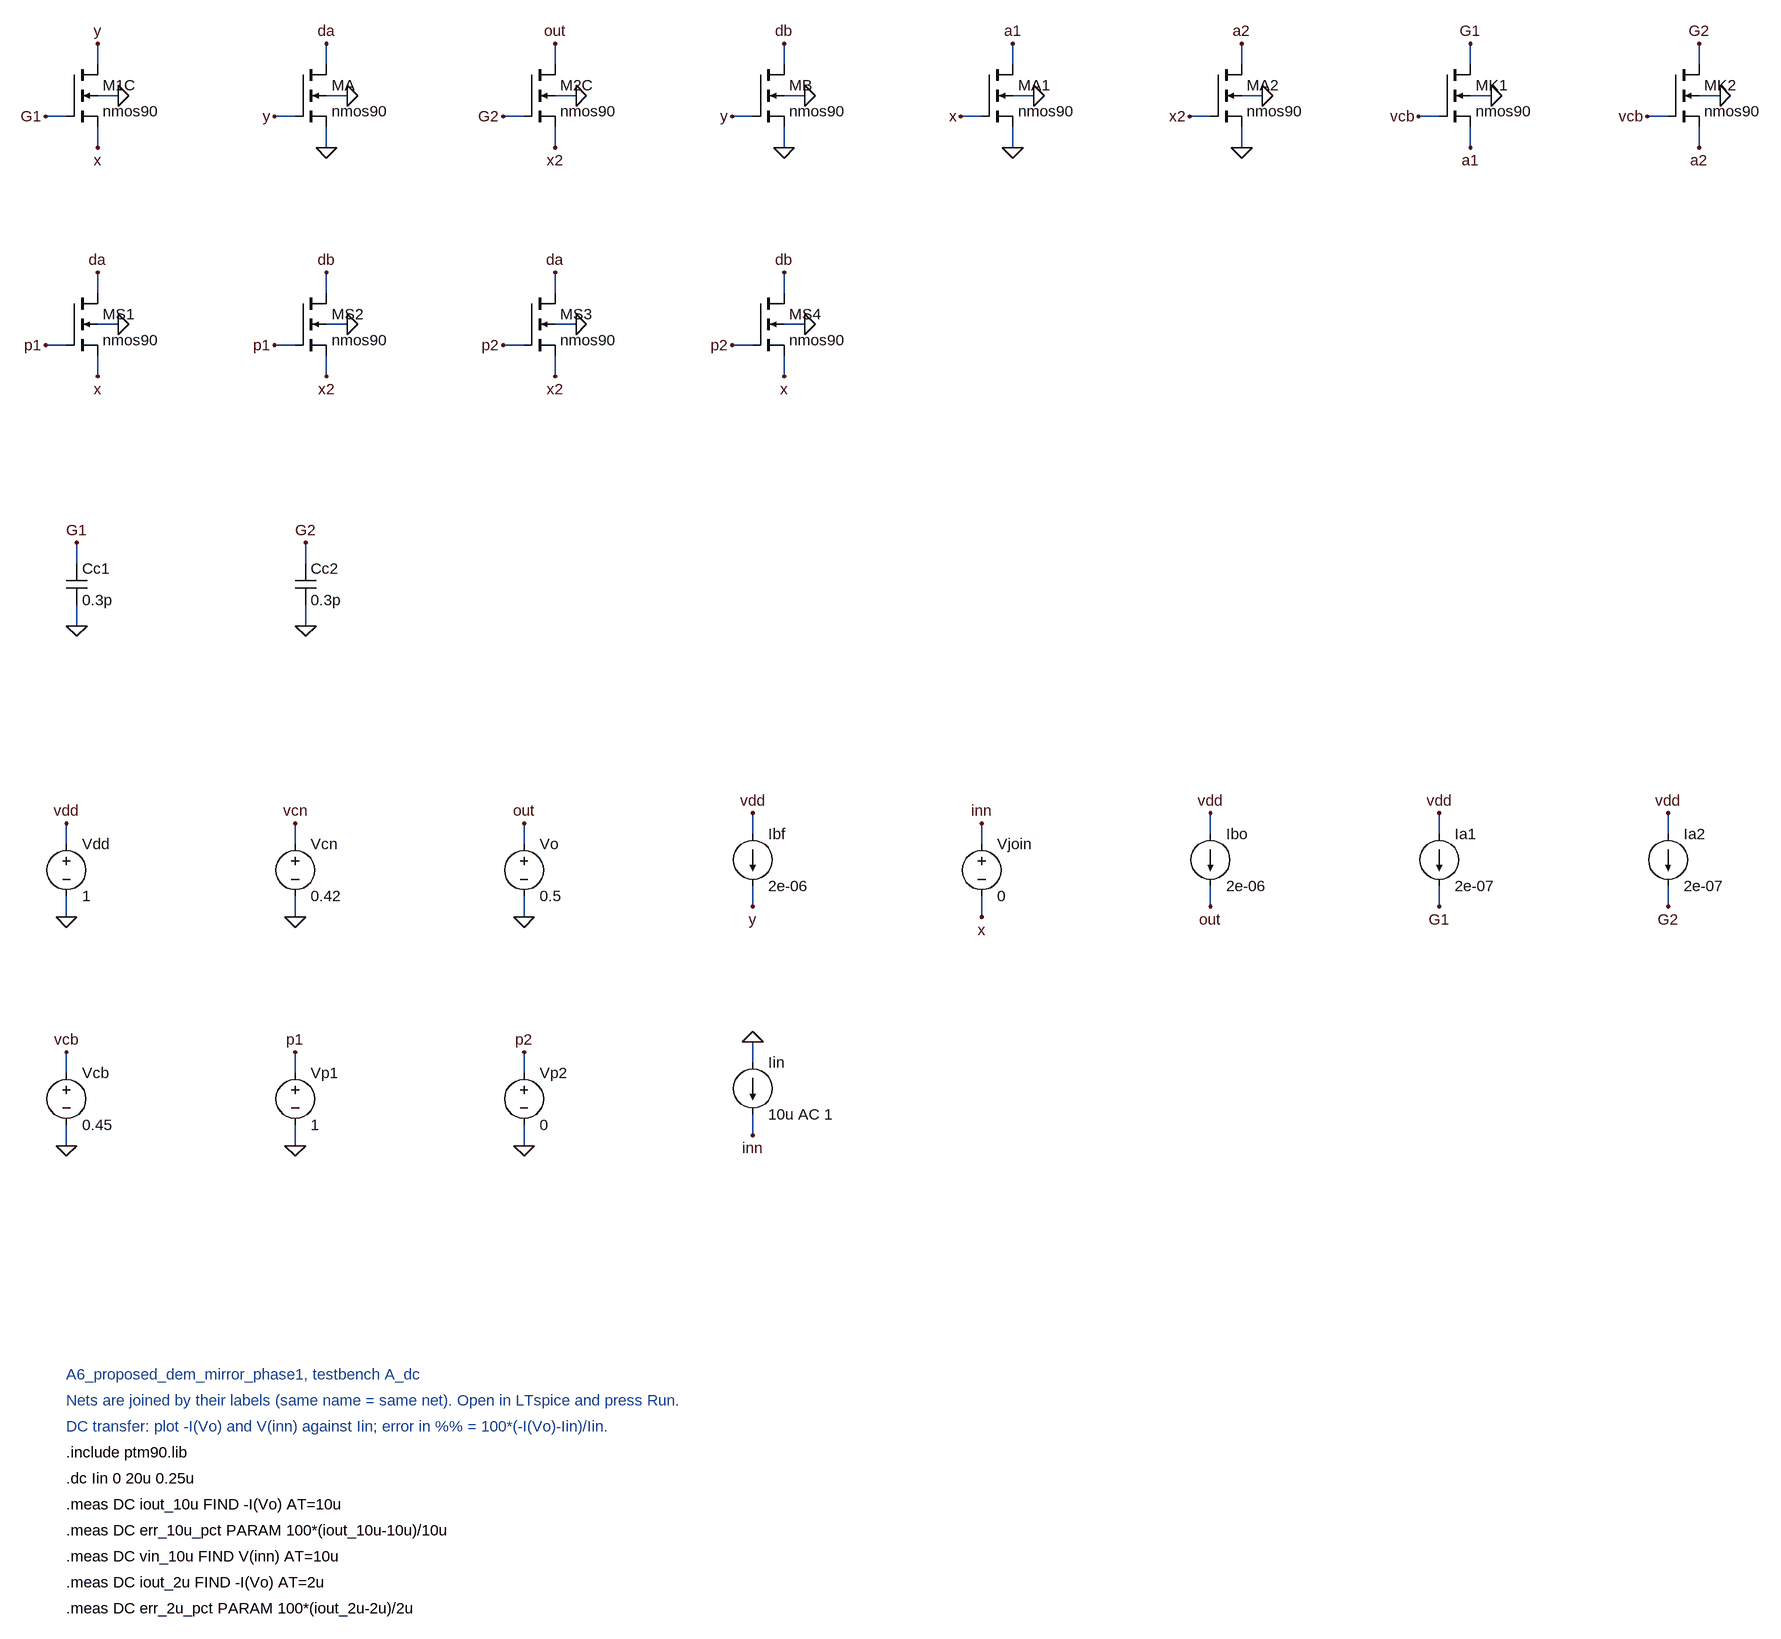
[diagram p0: schematic A6_proposed_dem_mirror_phase1_A_dc.asc]
A6_proposed_dem_mirror_phase1_A_dc.asc, the LTspice schematic file:
Version 4
SHEET 1 3200 2400
WIRE 48 0 48 -32
WIRE 0 80 -32 80
WIRE 48 96 48 128
WIRE 48 48 80 48
WIRE 400 0 400 -32
WIRE 352 80 320 80
WIRE 400 96 400 128
WIRE 400 48 432 48
WIRE 752 0 752 -32
WIRE 704 80 672 80
WIRE 752 96 752 128
WIRE 752 48 784 48
WIRE 1104 0 1104 -32
WIRE 1056 80 1024 80
WIRE 1104 96 1104 128
WIRE 1104 48 1136 48
WIRE 1456 0 1456 -32
WIRE 1408 80 1376 80
WIRE 1456 96 1456 128
WIRE 1456 48 1488 48
WIRE 1808 0 1808 -32
WIRE 1760 80 1728 80
WIRE 1808 96 1808 128
WIRE 1808 48 1840 48
WIRE 2160 0 2160 -32
WIRE 2112 80 2080 80
WIRE 2160 96 2160 128
WIRE 2160 48 2192 48
WIRE 2512 0 2512 -32
WIRE 2464 80 2432 80
WIRE 2512 96 2512 128
WIRE 2512 48 2544 48
WIRE 48 352 48 320
WIRE 0 432 -32 432
WIRE 48 448 48 480
WIRE 48 400 80 400
WIRE 400 352 400 320
WIRE 352 432 320 432
WIRE 400 448 400 480
WIRE 400 400 432 400
WIRE 752 352 752 320
WIRE 704 432 672 432
WIRE 752 448 752 480
WIRE 752 400 784 400
WIRE 1104 352 1104 320
WIRE 1056 432 1024 432
WIRE 1104 448 1104 480
WIRE 1104 400 1136 400
WIRE 16 768 16 736
WIRE 16 832 16 864
WIRE 368 768 368 736
WIRE 368 832 368 864
WIRE 0 1200 0 1168
WIRE 0 1280 0 1312
WIRE 352 1200 352 1168
WIRE 352 1280 352 1312
WIRE 704 1200 704 1168
WIRE 704 1280 704 1312
WIRE 1056 1184 1056 1152
WIRE 1056 1264 1056 1296
WIRE 1408 1200 1408 1168
WIRE 1408 1280 1408 1312
WIRE 1760 1184 1760 1152
WIRE 1760 1264 1760 1296
WIRE 2112 1184 2112 1152
WIRE 2112 1264 2112 1296
WIRE 2464 1184 2464 1152
WIRE 2464 1264 2464 1296
WIRE 0 1552 0 1520
WIRE 0 1632 0 1664
WIRE 352 1552 352 1520
WIRE 352 1632 352 1664
WIRE 704 1552 704 1520
WIRE 704 1632 704 1664
WIRE 1056 1536 1056 1504
WIRE 1056 1616 1056 1648
FLAG 48 -32 y
FLAG -32 80 G1
FLAG 48 128 x
FLAG 80 48 0
FLAG 400 -32 da
FLAG 320 80 y
FLAG 400 128 0
FLAG 432 48 0
FLAG 752 -32 out
FLAG 672 80 G2
FLAG 752 128 x2
FLAG 784 48 0
FLAG 1104 -32 db
FLAG 1024 80 y
FLAG 1104 128 0
FLAG 1136 48 0
FLAG 1456 -32 a1
FLAG 1376 80 x
FLAG 1456 128 0
FLAG 1488 48 0
FLAG 1808 -32 a2
FLAG 1728 80 x2
FLAG 1808 128 0
FLAG 1840 48 0
FLAG 2160 -32 G1
FLAG 2080 80 vcb
FLAG 2160 128 a1
FLAG 2192 48 0
FLAG 2512 -32 G2
FLAG 2432 80 vcb
FLAG 2512 128 a2
FLAG 2544 48 0
FLAG 48 320 da
FLAG -32 432 p1
FLAG 48 480 x
FLAG 80 400 0
FLAG 400 320 db
FLAG 320 432 p1
FLAG 400 480 x2
FLAG 432 400 0
FLAG 752 320 da
FLAG 672 432 p2
FLAG 752 480 x2
FLAG 784 400 0
FLAG 1104 320 db
FLAG 1024 432 p2
FLAG 1104 480 x
FLAG 1136 400 0
FLAG 16 736 G1
FLAG 16 864 0
FLAG 368 736 G2
FLAG 368 864 0
FLAG 0 1168 vdd
FLAG 0 1312 0
FLAG 352 1168 vcn
FLAG 352 1312 0
FLAG 704 1168 out
FLAG 704 1312 0
FLAG 1056 1152 vdd
FLAG 1056 1296 y
FLAG 1408 1168 inn
FLAG 1408 1312 x
FLAG 1760 1152 vdd
FLAG 1760 1296 out
FLAG 2112 1152 vdd
FLAG 2112 1296 G1
FLAG 2464 1152 vdd
FLAG 2464 1296 G2
FLAG 0 1520 vcb
FLAG 0 1664 0
FLAG 352 1520 p1
FLAG 352 1664 0
FLAG 704 1520 p2
FLAG 704 1664 0
FLAG 1056 1504 0
FLAG 1056 1648 inn
SYMBOL nmos4 0 0 R0
SYMATTR InstName M1C
SYMATTR Value nmos90
SYMATTR Value2 W=10u L=360n
SYMBOL nmos4 352 0 R0
SYMATTR InstName MA
SYMATTR Value nmos90
SYMATTR Value2 W=10u L=360n
SYMBOL nmos4 704 0 R0
SYMATTR InstName M2C
SYMATTR Value nmos90
SYMATTR Value2 W=10u L=360n
SYMBOL nmos4 1056 0 R0
SYMATTR InstName MB
SYMATTR Value nmos90
SYMATTR Value2 W=10u L=360n
SYMBOL nmos4 1408 0 R0
SYMATTR InstName MA1
SYMATTR Value nmos90
SYMATTR Value2 W=8u L=360n
SYMBOL nmos4 1760 0 R0
SYMATTR InstName MA2
SYMATTR Value nmos90
SYMATTR Value2 W=8u L=360n
SYMBOL nmos4 2112 0 R0
SYMATTR InstName MK1
SYMATTR Value nmos90
SYMATTR Value2 W=2u L=360n
SYMBOL nmos4 2464 0 R0
SYMATTR InstName MK2
SYMATTR Value nmos90
SYMATTR Value2 W=2u L=360n
SYMBOL nmos4 0 352 R0
SYMATTR InstName MS1
SYMATTR Value nmos90
SYMATTR Value2 W=4u L=0.1u
SYMBOL nmos4 352 352 R0
SYMATTR InstName MS2
SYMATTR Value nmos90
SYMATTR Value2 W=4u L=0.1u
SYMBOL nmos4 704 352 R0
SYMATTR InstName MS3
SYMATTR Value nmos90
SYMATTR Value2 W=4u L=0.1u
SYMBOL nmos4 1056 352 R0
SYMATTR InstName MS4
SYMATTR Value nmos90
SYMATTR Value2 W=4u L=0.1u
SYMBOL cap 0 768 R0
SYMATTR InstName Cc1
SYMATTR Value 0.3p
SYMBOL cap 352 768 R0
SYMATTR InstName Cc2
SYMATTR Value 0.3p
SYMBOL voltage 0 1184 R0
SYMATTR InstName Vdd
SYMATTR Value 1
SYMBOL voltage 352 1184 R0
SYMATTR InstName Vcn
SYMATTR Value 0.42
SYMBOL voltage 704 1184 R0
SYMATTR InstName Vo
SYMATTR Value 0.5
SYMBOL current 1056 1184 R0
SYMATTR InstName Ibf
SYMATTR Value 2e-06
SYMBOL voltage 1408 1184 R0
SYMATTR InstName Vjoin
SYMATTR Value 0
SYMBOL current 1760 1184 R0
SYMATTR InstName Ibo
SYMATTR Value 2e-06
SYMBOL current 2112 1184 R0
SYMATTR InstName Ia1
SYMATTR Value 2e-07
SYMBOL current 2464 1184 R0
SYMATTR InstName Ia2
SYMATTR Value 2e-07
SYMBOL voltage 0 1536 R0
SYMATTR InstName Vcb
SYMATTR Value 0.45
SYMBOL voltage 352 1536 R0
SYMATTR InstName Vp1
SYMATTR Value 1
SYMBOL voltage 704 1536 R0
SYMATTR InstName Vp2
SYMATTR Value 0
SYMBOL current 1056 1536 R0
SYMATTR InstName Iin
SYMATTR Value 10u AC 1
TEXT 0 2016 Left 2 ;A6_proposed_dem_mirror_phase1, testbench A_dc
TEXT 0 2056 Left 2 ;Nets are joined by their labels (same name = same net). Open in LTspice and press Run.
TEXT 0 2096 Left 2 ;DC transfer: plot -I(Vo) and V(inn) against Iin; error in %% = 100*(-I(Vo)-Iin)/Iin.
TEXT 0 2136 Left 2 !.include ptm90.lib
TEXT 0 2176 Left 2 !.dc Iin 0 20u 0.25u
TEXT 0 2216 Left 2 !.meas DC iout_10u FIND -I(Vo) AT=10u
TEXT 0 2256 Left 2 !.meas DC err_10u_pct PARAM 100*(iout_10u-10u)/10u
TEXT 0 2296 Left 2 !.meas DC vin_10u FIND V(inn) AT=10u
TEXT 0 2336 Left 2 !.meas DC iout_2u FIND -I(Vo) AT=2u
TEXT 0 2376 Left 2 !.meas DC err_2u_pct PARAM 100*(iout_2u-2u)/2u

The netlist it stands for:
* A6_proposed_dem_mirror_phase1_A_dc.asc
M1C y G1 x 0 nmos90 W=10u L=360n
MA da y 0 0 nmos90 W=10u L=360n
M2C out G2 x2 0 nmos90 W=10u L=360n
MB db y 0 0 nmos90 W=10u L=360n
MA1 a1 x 0 0 nmos90 W=8u L=360n
MA2 a2 x2 0 0 nmos90 W=8u L=360n
MK1 G1 vcb a1 0 nmos90 W=2u L=360n
MK2 G2 vcb a2 0 nmos90 W=2u L=360n
MS1 da p1 x 0 nmos90 W=4u L=0.1u
MS2 db p1 x2 0 nmos90 W=4u L=0.1u
MS3 da p2 x2 0 nmos90 W=4u L=0.1u
MS4 db p2 x 0 nmos90 W=4u L=0.1u
Cc1 G1 0 0.3p
Cc2 G2 0 0.3p
Vdd vdd 0 1
Vcn vcn 0 0.42
Vo out 0 0.5
Ibf vdd y 2e-06
Vjoin inn x 0
Ibo vdd out 2e-06
Ia1 vdd G1 2e-07
Ia2 vdd G2 2e-07
Vcb vcb 0 0.45
Vp1 p1 0 1
Vp2 p2 0 0
Iin 0 inn 10u AC 1
.model NMOS NMOS
.model PMOS PMOS
.lib standard.mos
* A6_proposed_dem_mirror_phase1, testbench A_dc
* Nets are joined by their labels (same name = same net). Open in LTspice and press Run.
* DC transfer: plot -I(Vo) and V(inn) against Iin; error in %% = 100*(-I(Vo)-Iin)/Iin.
.include ptm90.lib
.dc Iin 0 20u 0.25u
.meas DC iout_10u FIND -I(Vo) AT=10u
.meas DC err_10u_pct PARAM 100*(iout_10u-10u)/10u
.meas DC vin_10u FIND V(inn) AT=10u
.meas DC iout_2u FIND -I(Vo) AT=2u
.meas DC err_2u_pct PARAM 100*(iout_2u-2u)/2u
.backanno
.end